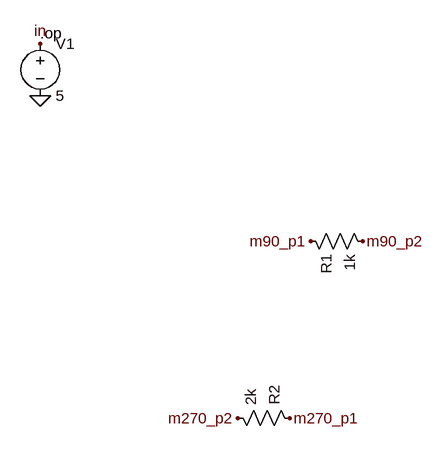
[diagram p0: schematic ltspice-import-mirror-reference.asc]
ltspice-import-mirror-reference.asc, the LTspice schematic file:
Version 4
SHEET 1 1000 700
SYMBOL voltage 0 0 R0
SYMATTR InstName V1
SYMATTR Value 5
FLAG 0 16 in
FLAG 0 96 0
SYMBOL res 400 304 M90
SYMATTR InstName R1
SYMATTR Value 1k
FLAG 416 320 m90_p1
FLAG 496 320 m90_p2
SYMBOL res 400 608 M270
SYMATTR InstName R2
SYMATTR Value 2k
FLAG 384 592 m270_p1
FLAG 304 592 m270_p2
TEXT 0 0 Left 2 !.op

The netlist it stands for:
* ltspice-import-mirror-reference.asc
V1 in 0 5
R1 m90_p1 m90_p2 1k
R2 m270_p1 m270_p2 2k
.op
.backanno
.end